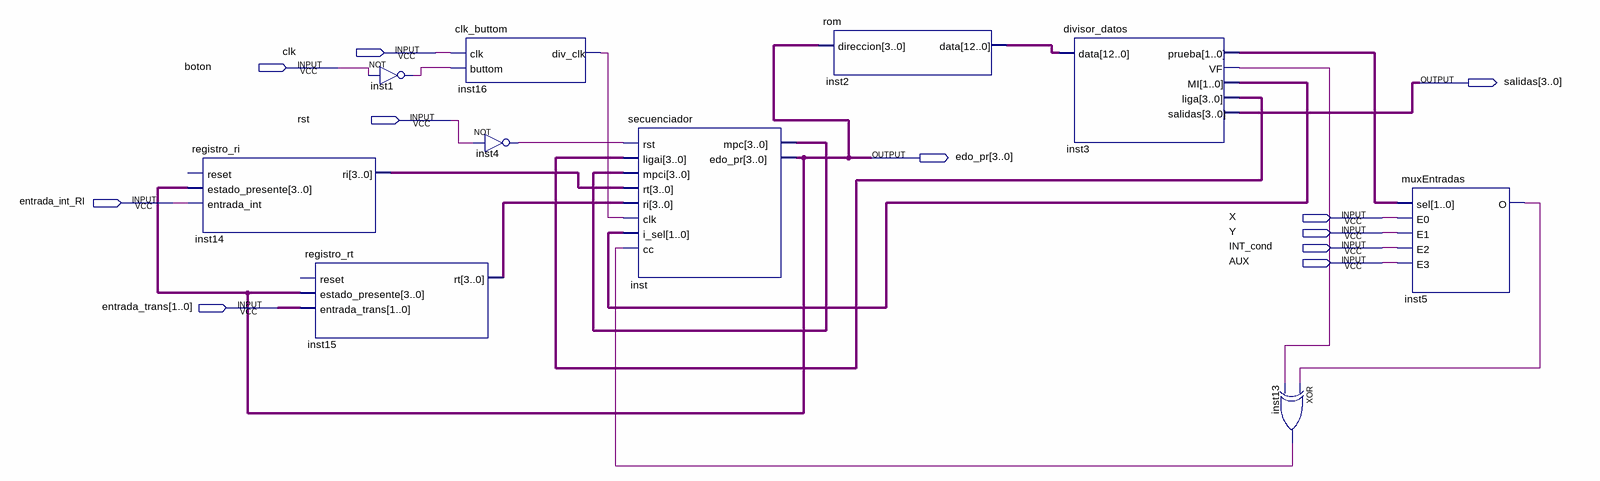
[diagram p0: schematic sheet]
// Quartus schematic practica6.bdf as structural Verilog: 10 symbols, 11 pins
module practica6 (
  input  clk,
  input  boton,
  input  rst,
  input  entrada_int_RI,
  input  X,
  input  Y,
  input  INT_cond,
  input  AUX,
  input  [1:0] entrada_trans,
  output [3:0] salidas,
  output [3:0] edo_pr
);

  wire inst1_out, inst3_vf, inst4_out, inst5_o, inst13_out, inst16_div_clk;
  wire [1:0] inst3_mi, inst3_prueba;
  wire [3:0] inst3_liga, inst14_ri, inst15_rt, inst_mpc;
  wire [12:0] inst2_data;

  registro_ri inst14 (.estado_presente(edo_pr), .entrada_int(entrada_int_RI), .ri(inst14_ri));  // open: reset
  registro_rt inst15 (.estado_presente(edo_pr), .entrada_trans(entrada_trans), .rt(inst15_rt));  // open: reset
  not inst1 (inst1_out, boton);
  clk_buttom inst16 (.clk(clk), .buttom(inst1_out), .div_clk(inst16_div_clk));
  not inst4 (inst4_out, rst);
  secuenciador inst (
    .rst(inst4_out), .ligai(inst3_liga), .mpci(inst_mpc), .rt(inst14_ri), .ri(inst15_rt),
    .clk(inst16_div_clk), .i_sel(inst3_mi), .cc(inst13_out), .mpc(inst_mpc), .edo_pr(edo_pr));
  rom inst2 (.direccion(edo_pr), .data(inst2_data));
  divisor_datos inst3 (
    .data(inst2_data), .prueba(inst3_prueba), .VF(inst3_vf), .MI(inst3_mi), .liga(inst3_liga),
    .salidas(salidas));
  xor inst13 (inst13_out, inst5_o, inst3_vf);
  muxEntradas inst5 (.sel(inst3_prueba), .E0(X), .E1(Y), .E2(INT_cond), .E3(AUX), .O(inst5_o));
endmodule
